# Altium schematic sheet Input_Comparator_Frontend.SchDoc: Input Comparator Frontend
size A4; SheetNumber: 8; SheetTotal: 9
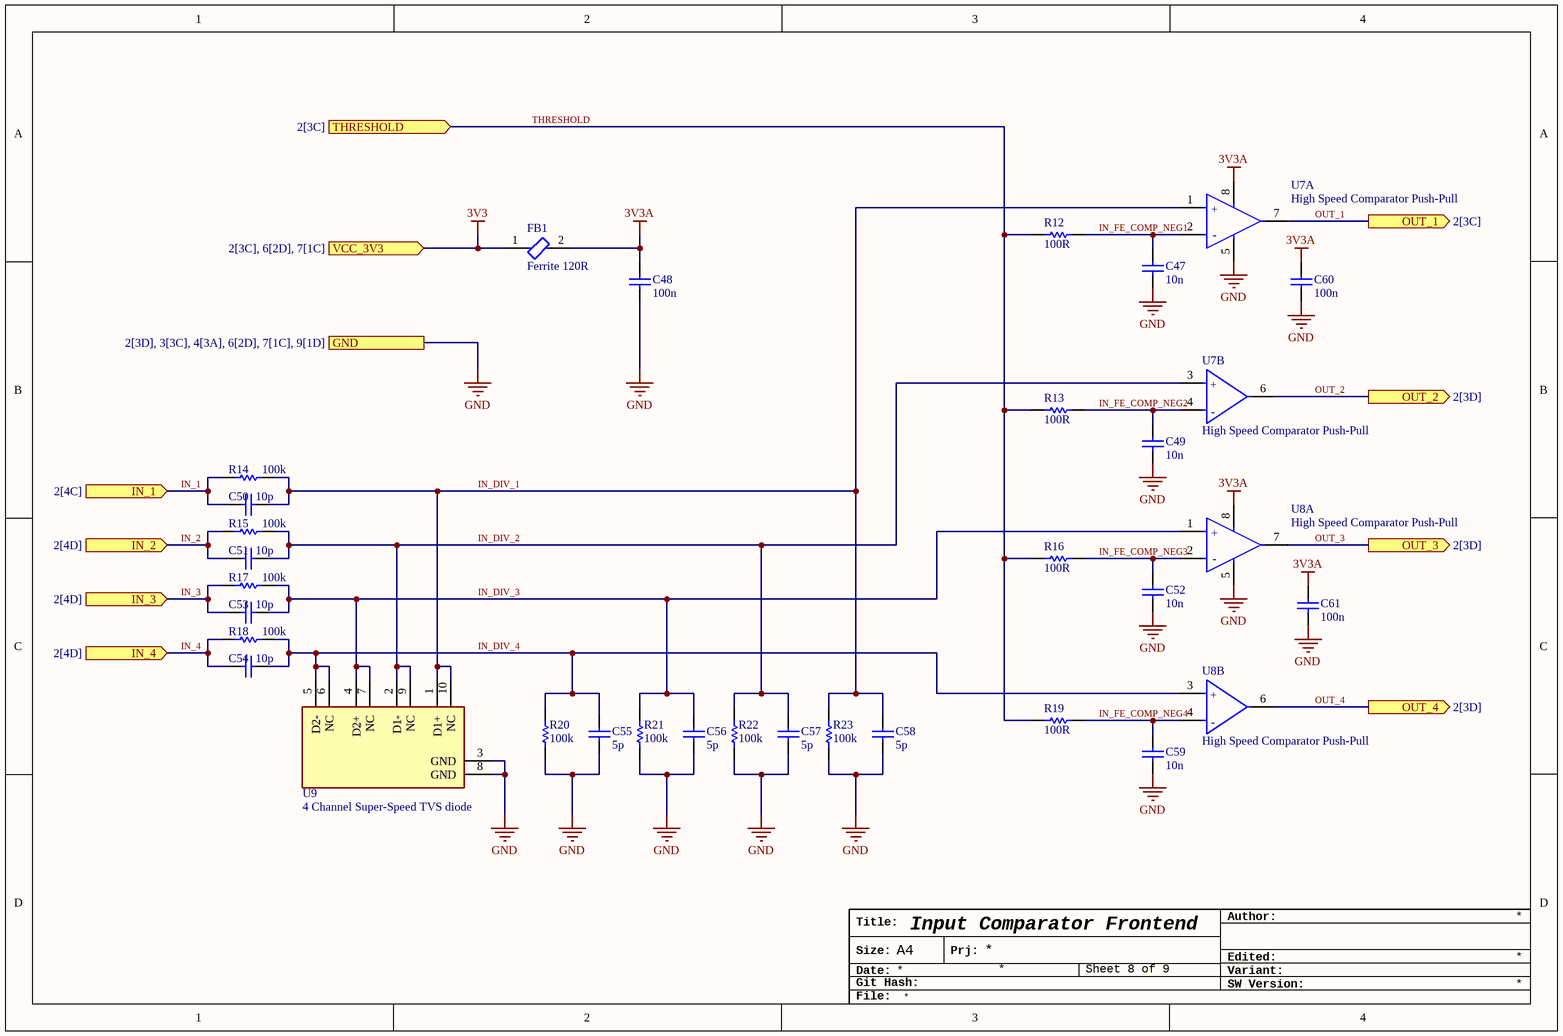
[diagram p0: Input_Comparator_Frontend.SchDoc]

## Parts
C47  value 10n  [CAPC1607X09L - 0603]  (hidden comment: 10nF 100V)
C48  value 100n  [CAPC1607X09L - 0603]  (hidden comment: 100nF 50V)
C49  value 10n  [CAPC1607X09L - 0603]  (hidden comment: 10nF 100V)
C50  value 10p  [CAPC1607X09L - 0603]  (hidden comment: 10pF 100V)
C51  value 10p  [CAPC1607X09L - 0603]  (hidden comment: 10pF 100V)
C52  value 10n  [CAPC1607X09L - 0603]  (hidden comment: 10nF 100V)
C53  value 10p  [CAPC1607X09L - 0603]  (hidden comment: 10pF 100V)
C54  value 10p  [CAPC1607X09L - 0603]  (hidden comment: 10pF 100V)
C55  value 5p  [CAPC1607X09L - 0603]  (hidden comment: 5pF 100V)
C56  value 5p  [CAPC1607X09L - 0603]  (hidden comment: 5pF 100V)
C57  value 5p  [CAPC1607X09L - 0603]  (hidden comment: 5pF 100V)
C58  value 5p  [CAPC1607X09L - 0603]  (hidden comment: 5pF 100V)
C59  value 10n  [CAPC1607X09L - 0603]  (hidden comment: 10nF 100V)
C60  value 100n  [CAPC1607X09L - 0603]  (hidden comment: 100nF 50V)
C61  value 100n  [CAPC1607X09L - 0603]  (hidden comment: 100nF 50V)
FB1  Ferrite 120R  [muRata 0603 Ferrite Bead]
R12  100R  [RESC1508X05L - 0603]
R13  100R  [RESC1508X05L - 0603]
R14  100k  [RESC1508X05L - 0603]
R15  100k  [RESC1508X05L - 0603]
R16  100R  [RESC1508X05L - 0603]
R17  100k  [RESC1508X05L - 0603]
R18  100k  [RESC1508X05L - 0603]
R19  100R  [RESC1508X05L - 0603]
R20  100k  [RESC1508X05L - 0603]
R21  100k  [RESC1508X05L - 0603]
R22  100k  [RESC1508X05L - 0603]
R23  100k  [RESC1508X05L - 0603]
U7  High Speed Comparator Push-Pull  [SOT23_8_TI]  (parts A,B of 2)
U8  High Speed Comparator Push-Pull  [SOT23_8_TI]  (parts A,B of 2)
U9  4 Channel Super-Speed TVS diode  [UFDFN10_TI]

## Ports
GND (see 2[3D], 3[3C], 4[3A], 6[2D], 7[1C], 9[1D]), IN_1 (in, see 2[4C]), IN_2 (in, see 2[4D]), IN_3 (in, see 2[4D]), IN_4 (in, see 2[4D]), OUT_1 (out, see 2[3C]), OUT_2 (out, see 2[3D]), OUT_3 (out, see 2[3D]), OUT_4 (out, see 2[3D]), THRESHOLD (in, see 2[3C]), VCC_3V3 (in, see 2[3C], 6[2D], 7[1C])

## Nets
3V3: FB1.1 ; port VCC_3V3
3V3A: C48.2 C60.2 C61.2 FB1.2 U7.8(V+) U8.8(V+)
GND: C47.1 C48.1 C49.1 C52.1 C55.1 C56.1 C57.1 C58.1 C59.1 C60.1 C61.1 R20.1 R21.1 R22.1 R23.1 U7.5(V-) U8.5(V-) U9.3(GND) U9.8(GND) ; port GND
IN_1: C50.1 R14.1 ; port IN_1
IN_2: C51.1 R15.1 ; port IN_2
IN_3: C53.1 R17.1 ; port IN_3
IN_4: C54.1 R18.1 ; port IN_4
IN_DIV_1: C50.2 C58.2 R14.2 R23.2 U7.1(+IN_A) U9.1(D1+) U9.10(NC)
IN_DIV_2: C51.2 C57.2 R15.2 R22.2 U7.3(+IN_B) U9.2(D1-) U9.9(NC)
IN_DIV_3: C53.2 C56.2 R17.2 R21.2 U8.1(+IN_A) U9.4(D2+) U9.7(NC)
IN_DIV_4: C54.2 C55.2 R18.2 R20.2 U8.3(+IN_B) U9.5(D2-) U9.6(NC)
IN_FE_COMP_NEG1: C47.2 R12.2 U7.2(-IN_A)
IN_FE_COMP_NEG2: C49.2 R13.2 U7.4(-IN_B)
IN_FE_COMP_NEG3: C52.2 R16.2 U8.2(-IN_A)
IN_FE_COMP_NEG4: C59.2 R19.2 U8.4(-IN_B)
OUT_1: U7.7(OUT_A) ; port OUT_1
OUT_2: U7.6(OUT_B) ; port OUT_2
OUT_3: U8.7(OUT_A) ; port OUT_3
OUT_4: U8.6(OUT_B) ; port OUT_4
THRESHOLD: R12.1 R13.1 R16.1 R19.1 ; port THRESHOLD

## Notes on the sheet
- Title:
- Author:
- Size:
- Date:
- Git Hash:
- A4
- Prj:
- SW Version:
- Variant:
- Edited:
- File:
- (in symbol IC-MPN-TLV3502AIDCNR, part A) +; -
- (in symbol IC-MPN-TLV3502AIDCNR, part B) +; -

## Library data of the parts
C47 C49 C52 C59 = CAP-0603-10nF-100V-X7R: Ceramic capacitor 10nF 100V X7R 0603; Supplier 1: DigiKey; Supplier Part Number 1: 490-5771-1-ND
C48 C60 C61 = CAP-0603-100nF-50V-X7R: Ceramic capacitor 100nF 50V X7R 0603; Supplier 1: DigiKey; Supplier Part Number 1: 490-5798-1-ND
C50 C51 C53 C54 = CAP-0603-10pF-100V-NP0: Ceramic capacitor 10pF 100V NP0 0603; Supplier 1: DigiKey; Supplier Part Number 1: 490-4770-1-ND
C55-C58 = CAP-0603-5pF-100V-NP0: Ceramic capacitor 5pF 100V NP0 0603; Supplier 1: DigiKey; Supplier Part Number 1: 490-4770-1-ND
FB1 = FER-0603-120R-3A: Ferrite Bead, 0603, 75Ω @ 100MHz, 25%, 1Ω, 200mA; Max Current Rating: 3A; DC Resistance (DCR): 30mR; Number of Lines: 1; Package Quantity: 4000; Min Operating Temperature: -55°C; Termination: SMD/SMT; REACH SVHC: No SVHC; Core Material: Ferrite; Material: Ferrite; Current Rating: 3A; Impedance: 120R; Height: 0.8mm; Number of Pins: 2; Case/Package: 0603; Test Frequency: 100MHz; Case Code (Imperial): 0603; Series: BLM18K; Packaging: Tape and Reel; Inductor Type: FERRITE BEAD; Tolerance: 25%; Lead Free: Lead Free; Width: 0.8mm; Case Code (Metric): 1608; Number of Circuits: 1; Max DC Current: 3A; Depth: 0.95mm; Max Operating Temperature: 125°C; Length: 1.6mm; RoHS Compliant: Yes
R12 R13 R16 R19 = RES-0603-100R-1%: 100R ±1% 0603 100mW 75V; Part Number: 0402WGF1001TCE; Manufacturer: UNI-ROYAL; Supplier 1: DigiKey; Supplier Part Number 1: 311-100HRCT-ND; Value: 100R
R14 R15 R17 R18 R20-R23 = RES-0603-100k-1%: 100k ±1% 0603 100mW 75V; Part Number: 0402WGF1001TCE; Manufacturer: UNI-ROYAL; Supplier 1: DigiKey; Supplier Part Number 1: 311-100KHRCT-ND; Value: 100k
U7 U8 = IC-MPN-TLV3502AIDCNR: ComponentLink2Description: Datasheet; ComponentLink2URL: http://www.ti.com/lit/ds/symlink/tlv3502.pdf
U9 = TVS-MPN-TPD4E05U06: 14V Clamp 2.5A (8/20µs) Ipp Tvs Diode Surface Mount USON-10; ComponentLink2Description: Datasheet; ComponentLink2URL: http://www.ti.com/lit/ds/symlink/tpd4e05u06-q1.pdf